# Altium project Flight Controller Base.PrjPcb (part 1 of 2)
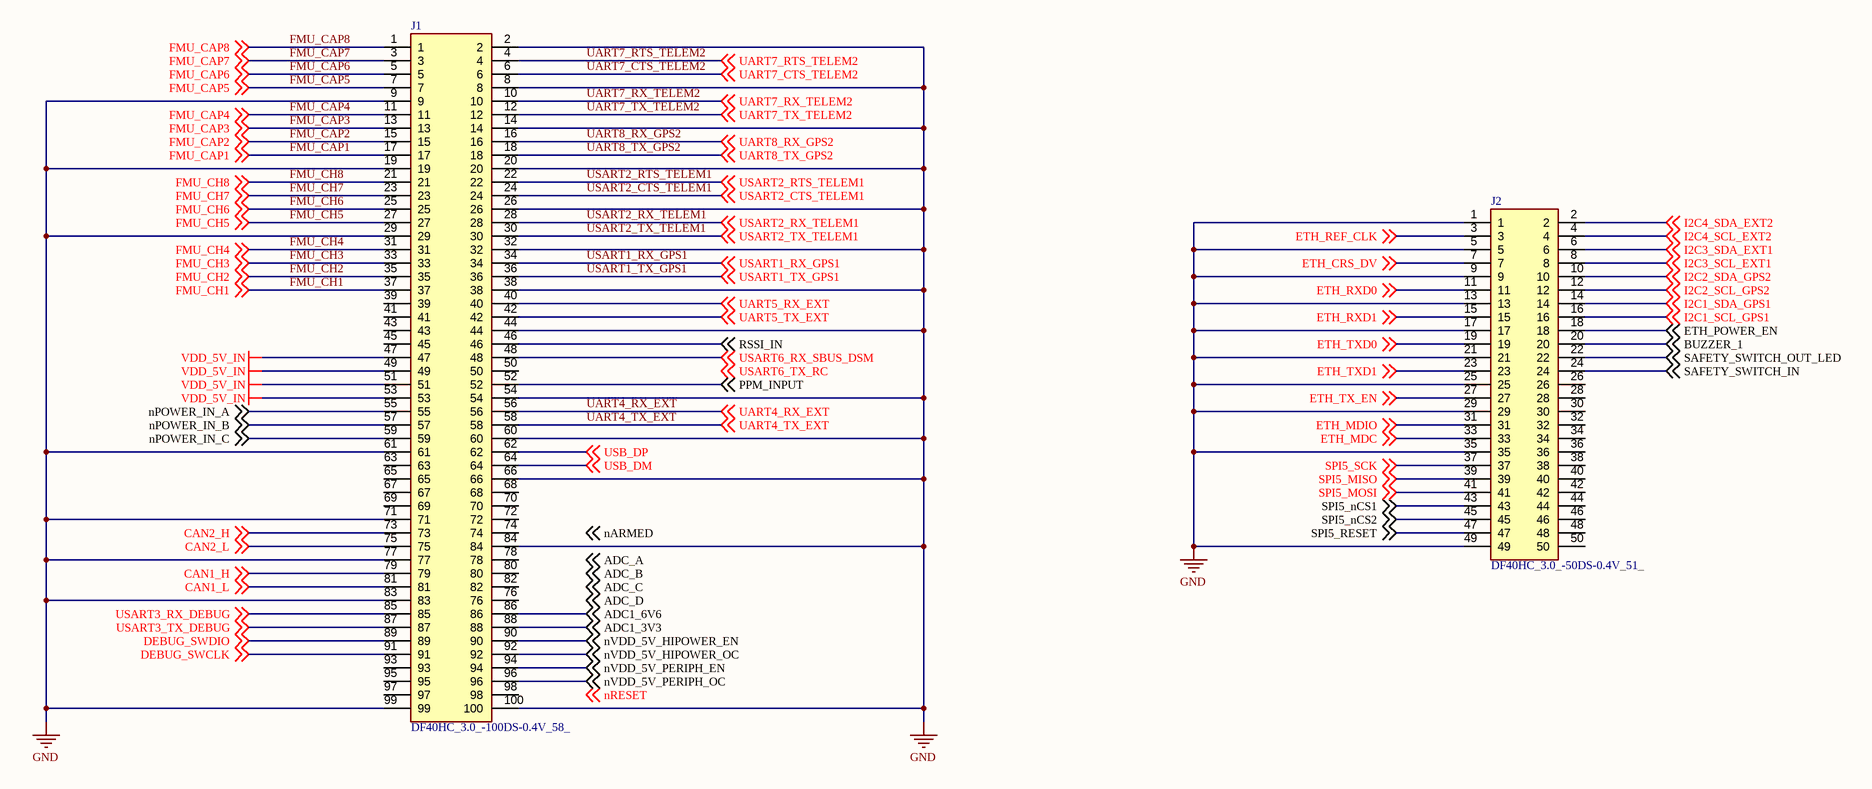
[diagram p0: S1_Connectors.SchDoc]
CAGE_CODE: ?????; CONTRACT_NUMBER: <CONTRACT NO>; DOC_NO_ASSY_DWG: <ASSY DWG NO>; DOC_NO_BOM: <BOM DOC NO>; DOC_NO_FAB_DWG: <FAB DWG NO>; DOC_NO_SCH_DWG: <SCH DWG NO>; PCB_2_DEC_TOL: +/-.01; PCB_3_DEC_TOL: +/-.010; PCB_ANG_TOL: +/-1/2; PCB_ASSEMBLY_NO: <PCB ASSY NO>; PCB_CHECKER: - -----; PCB_CHECKER_APP_DATE: --/--/----; PCB_DESIGNER: - -----; PCB_DESIGNER_APP_DATE: --/--/----; PCB_DWG_NO: <PCB DWG NO>; PCB_ENGINEER: - -----; PCB_ENGINEER_APP_DATE: --/--/----; PCB_PART_NUMBER: <PCB PN>; PCB_REV: A; SCH_REV: A
9 sheets, 243 parts. Net scope: global (net labels, ports and power ports of the same name join across sheets).
Board file: PCB1.PcbDoc
Sheets:
  S1_Connectors.SchDoc
  S2_Power.SchDoc
  S3_PowSwitch.SchDoc
  S4_Pwm_Ports.SchDoc
  S5_Gps_Telem_Ports.SchDoc
  S6_Debug_Safety_Port.SchDoc
  S7_Ethernet.SchDoc
  S6_Can_SPI_Uart_Ports.SchDoc
  S7_CRSF_IBUS_SBUS_DSM_Ports.SchDoc

## Sheet S1_Connectors.SchDoc
size 420 x 297 mm; Title2: hello; Project: myfc_base; ENG_APP_DATE: --/--/--; DSN_APP_DATE: --/--/--; CHK_APP_DATE: --/--/--; SheetNumber: 1; SheetTotal: 8

### Parts
J1  DF40HC_3.0_-100DS-0.4V_58_  [DF40HC30100DS04V58]
J2  DF40HC_3.0_-50DS-0.4V_51_  [DF40HC3050DS04V51]

### Nets
GND: J1.2 J1.8 J1.9 J1.14 J1.19 J1.20 J1.26 J1.29 J1.32 J1.38 J1.44 J1.54 J1.60 J1.61 J1.66 J1.71 J1.77 J1.83 J1.84 J1.99 J1.100 J2.1 J2.5 J2.9 J2.13 J2.17 J2.21 J2.25 J2.29 J2.35 J2.49
VDD_5V_IN: J1.47 J1.49 J1.51 J1.53
ADC1_3V3: J1.88 ; off-sheet ADC1_3V3
ADC1_6V6: J1.86 ; off-sheet ADC1_6V6
BUZZER_1: J2.20 ; off-sheet BUZZER_1
CAN1_H: J1.79 ; off-sheet CAN1_H
CAN1_L: J1.81 ; off-sheet CAN1_L
CAN2_H: J1.73 ; off-sheet CAN2_H
CAN2_L: J1.75 ; off-sheet CAN2_L
DEBUG_SWCLK: J1.91 ; off-sheet DEBUG_SWCLK  [project net SWCLK]
DEBUG_SWDIO: J1.89 ; off-sheet DEBUG_SWDIO  [project net SWDIO]
ETH_CRS_DV: J2.7 ; off-sheet ETH_CRS_DV
ETH_MDC: J2.33 ; off-sheet ETH_MDC
ETH_MDIO: J2.31 ; off-sheet ETH_MDIO
ETH_POWER_EN: J2.18 ; off-sheet ETH_POWER_EN
ETH_REF_CLK: J2.3 ; off-sheet ETH_REF_CLK
ETH_RXD0: J2.11 ; off-sheet ETH_RXD0
ETH_RXD1: J2.15 ; off-sheet ETH_RXD1
ETH_TX_EN: J2.27 ; off-sheet ETH_TX_EN
ETH_TXD0: J2.19 ; off-sheet ETH_TXD0
ETH_TXD1: J2.23 ; off-sheet ETH_TXD1
FMU_CAP1: J1.17 ; off-sheet FMU_CAP1
FMU_CAP2: J1.15 ; off-sheet FMU_CAP2
FMU_CAP3: J1.13 ; off-sheet FMU_CAP3
FMU_CAP4: J1.11 ; off-sheet FMU_CAP4
FMU_CAP5: J1.7 ; off-sheet FMU_CAP5
FMU_CAP6: J1.5 ; off-sheet FMU_CAP6
FMU_CAP7: J1.3 ; off-sheet FMU_CAP7
FMU_CAP8: J1.1 ; off-sheet FMU_CAP8
FMU_CH1: J1.37 ; off-sheet FMU_CH1
FMU_CH2: J1.35 ; off-sheet FMU_CH2
FMU_CH3: J1.33 ; off-sheet FMU_CH3
FMU_CH4: J1.31 ; off-sheet FMU_CH4
FMU_CH5: J1.27 ; off-sheet FMU_CH5
FMU_CH6: J1.25 ; off-sheet FMU_CH6
FMU_CH7: J1.23 ; off-sheet FMU_CH7
FMU_CH8: J1.21 ; off-sheet FMU_CH8
I2C1_SCL_GPS1: J2.16 ; off-sheet I2C1_SCL_GPS1
I2C1_SDA_GPS1: J2.14 ; off-sheet I2C1_SDA_GPS1
I2C2_SCL_GPS2: J2.12 ; off-sheet I2C2_SCL_GPS2
I2C2_SDA_GPS2: J2.10 ; off-sheet I2C2_SDA_GPS2
I2C3_SCL_EXT1: J2.8 ; off-sheet I2C3_SCL_EXT1
I2C3_SDA_EXT1: J2.6 ; off-sheet I2C3_SDA_EXT1
I2C4_SCL_EXT2: J2.4 ; off-sheet I2C4_SCL_EXT2
I2C4_SDA_EXT2: J2.2 ; off-sheet I2C4_SDA_EXT2
nPOWER_IN_A: J1.55 ; off-sheet nPOWER_IN_A
nPOWER_IN_B: J1.57 ; off-sheet nPOWER_IN_B
nPOWER_IN_C: J1.59 ; off-sheet nPOWER_IN_C
nVDD_5V_HIPOWER_EN: J1.90 ; off-sheet nVDD_5V_HIPOWER_EN
nVDD_5V_HIPOWER_OC: J1.92 ; off-sheet nVDD_5V_HIPOWER_OC
nVDD_5V_PERIPH_EN: J1.94 ; off-sheet nVDD_5V_PERIPH_EN
nVDD_5V_PERIPH_OC: J1.96 ; off-sheet nVDD_5V_PERIPH_OC
PPM_INPUT: J1.52 ; off-sheet PPM_INPUT
RSSI_IN: J1.46 ; off-sheet RSSI_IN
SAFETY_SWITCH_IN: J2.24 ; off-sheet SAFETY_SWITCH_IN
SAFETY_SWITCH_OUT_LED: J2.22 ; off-sheet SAFETY_SWITCH_OUT_LED
SPI5_MISO: J2.39 ; off-sheet SPI5_MISO
SPI5_MOSI: J2.41 ; off-sheet SPI5_MOSI
SPI5_nCS1: J2.43 ; off-sheet SPI5_nCS1
SPI5_nCS2: J2.45 ; off-sheet SPI5_nCS2
SPI5_RESET: J2.47 ; off-sheet SPI5_RESET
SPI5_SCK: J2.37 ; off-sheet SPI5_SCK
UART4_RX_EXT: J1.56 ; off-sheet UART4_RX_EXT
UART4_TX_EXT: J1.58 ; off-sheet UART4_TX_EXT
UART5_RX_EXT: J1.40 ; off-sheet UART5_RX_EXT
UART5_TX_EXT: J1.42 ; off-sheet UART5_TX_EXT
UART7_CTS_TELEM2: J1.6 ; off-sheet UART7_CTS_TELEM2
UART7_RTS_TELEM2: J1.4 ; off-sheet UART7_RTS_TELEM2
UART7_RX_TELEM2: J1.10 ; off-sheet UART7_RX_TELEM2
UART7_TX_TELEM2: J1.12 ; off-sheet UART7_TX_TELEM2
UART8_RX_GPS2: J1.16 ; off-sheet UART8_RX_GPS2
UART8_TX_GPS2: J1.18 ; off-sheet UART8_TX_GPS2
USART1_RX_GPS1: J1.34 ; off-sheet USART1_RX_GPS1
USART1_TX_GPS1: J1.36 ; off-sheet USART1_TX_GPS1
USART2_CTS_TELEM1: J1.24 ; off-sheet USART2_CTS_TELEM1
USART2_RTS_TELEM1: J1.22 ; off-sheet USART2_RTS_TELEM1
USART2_RX_TELEM1: J1.28 ; off-sheet USART2_RX_TELEM1
USART2_TX_TELEM1: J1.30 ; off-sheet USART2_TX_TELEM1
USART3_RX_DEBUG: J1.85 ; off-sheet USART3_RX_DEBUG
USART3_TX_DEBUG: J1.87 ; off-sheet USART3_TX_DEBUG
USART6_RX_SBUS_DSM: J1.48 ; off-sheet USART6_RX_SBUS_DSM
USB_DM: J1.64 ; off-sheet USB_DM
USB_DP: J1.62 ; off-sheet USB_DP

Not connected (* = marked no-connect by the designer): J1 39 41 43 45 50 63 65 67 68 69 70 72 74 76 78 80 82 93 95 97 98; J2 26 28 30 32 34 36 38 40 42 44 46 48 50

### Notes on the sheet
- Labels drawn without touching a wire or pin: ADC_A, ADC_B, ADC_C, ADC_D, nARMED, nRESET, USART6_TX_RC
- THIS DOCUMENT AND THE DATA DISCLOSED HEREIN OR
- HEREWITH IS THE PROPERTY OF ALTIUM LIMITED AND MAY
- DWG NO:
- REVISION
- REV:
- DESCRIPTION
- DATE
- APPROVED
- BE FREELY DISTRIBUTED IN WHOLE. NO RIGHTS ARE
- RESERVED OR EXPRESS OR IMPLIED WARANTEE GIVEN.
- ENG:
- APPROVALS
- PROJECT
- DSN:
- CHK:
- REFERENCE DOCUMENTS
- PROJECT REVISION:
- TITLE
- DOCUMENT REVISION:
- DESIGN ITEM:
- BOM:
- FAB DWG:
- PCB DWG:
- ASSY DWG:
- SCALE:
- A3
- SIZE
- CAGE CODE
- FILE NAME
- DWG NO.
- SHEET
- OF
- REV

### Library data of the parts
J1 = CMP-002-00075-1: Hirose DF40 Series 0.4mm Pitch 100 Way 2 Row Straight PCB Socket, Surface Mount, Solder Termination; Manufacturer_Part_Number: DF40HC(3.0)-100DS-0.4V(58); Geometry.Height: 3.05mm; Datasheet Link: https://www.hirose.com/product/document?clcode=CL0684-4003-3-51&productname=DF40C-60DP-0.4V(51)&series=DF40&documenttype=Catalog&lang=en&documentid=D31649_en; Mouser Price/Stock: *; Source: DF40HC_3.0_-100DS-0.4V_58_.SchLib; Mouser Part Number: *; Design Item ID: DF40HC_3.0_-100DS-0.4V_58_; Manufacturer_Name: Hirose
J2 = CMP-002-00077-1: Board to Board & Mezzanine Connectors 50P RECPT 3.0 STK HT W/O METAL FITTING; Manufacturer_Name: Hirose; Manufacturer_Part_Number: DF40HC(3.0)-50DS-0.4V(51); Geometry.Height: 3.05mm; Design Item ID: DF40HC_3.0_-50DS-0.4V_51_; Datasheet Link: https://www.arrow.com/en/products/df40hc-3.0-50ds-0.4v-51/hirose-electric?region=nac; Mouser Part Number: 798-DF40HC3050DS04V; Mouser Price/Stock: https://www.mouser.co.uk/ProductDetail/Hirose-Connector/DF40HC3.0-50DS-0.4V51?qs=3aug5cyrIbckh%2FQLfpkocw%3D%3D; Source: DF40HC_3.0_-50DS-0.4V_51_.SchLib

## Sheet S2_Power.SchDoc
size 420 x 297 mm; SheetNumber: 2; SheetTotal: 7
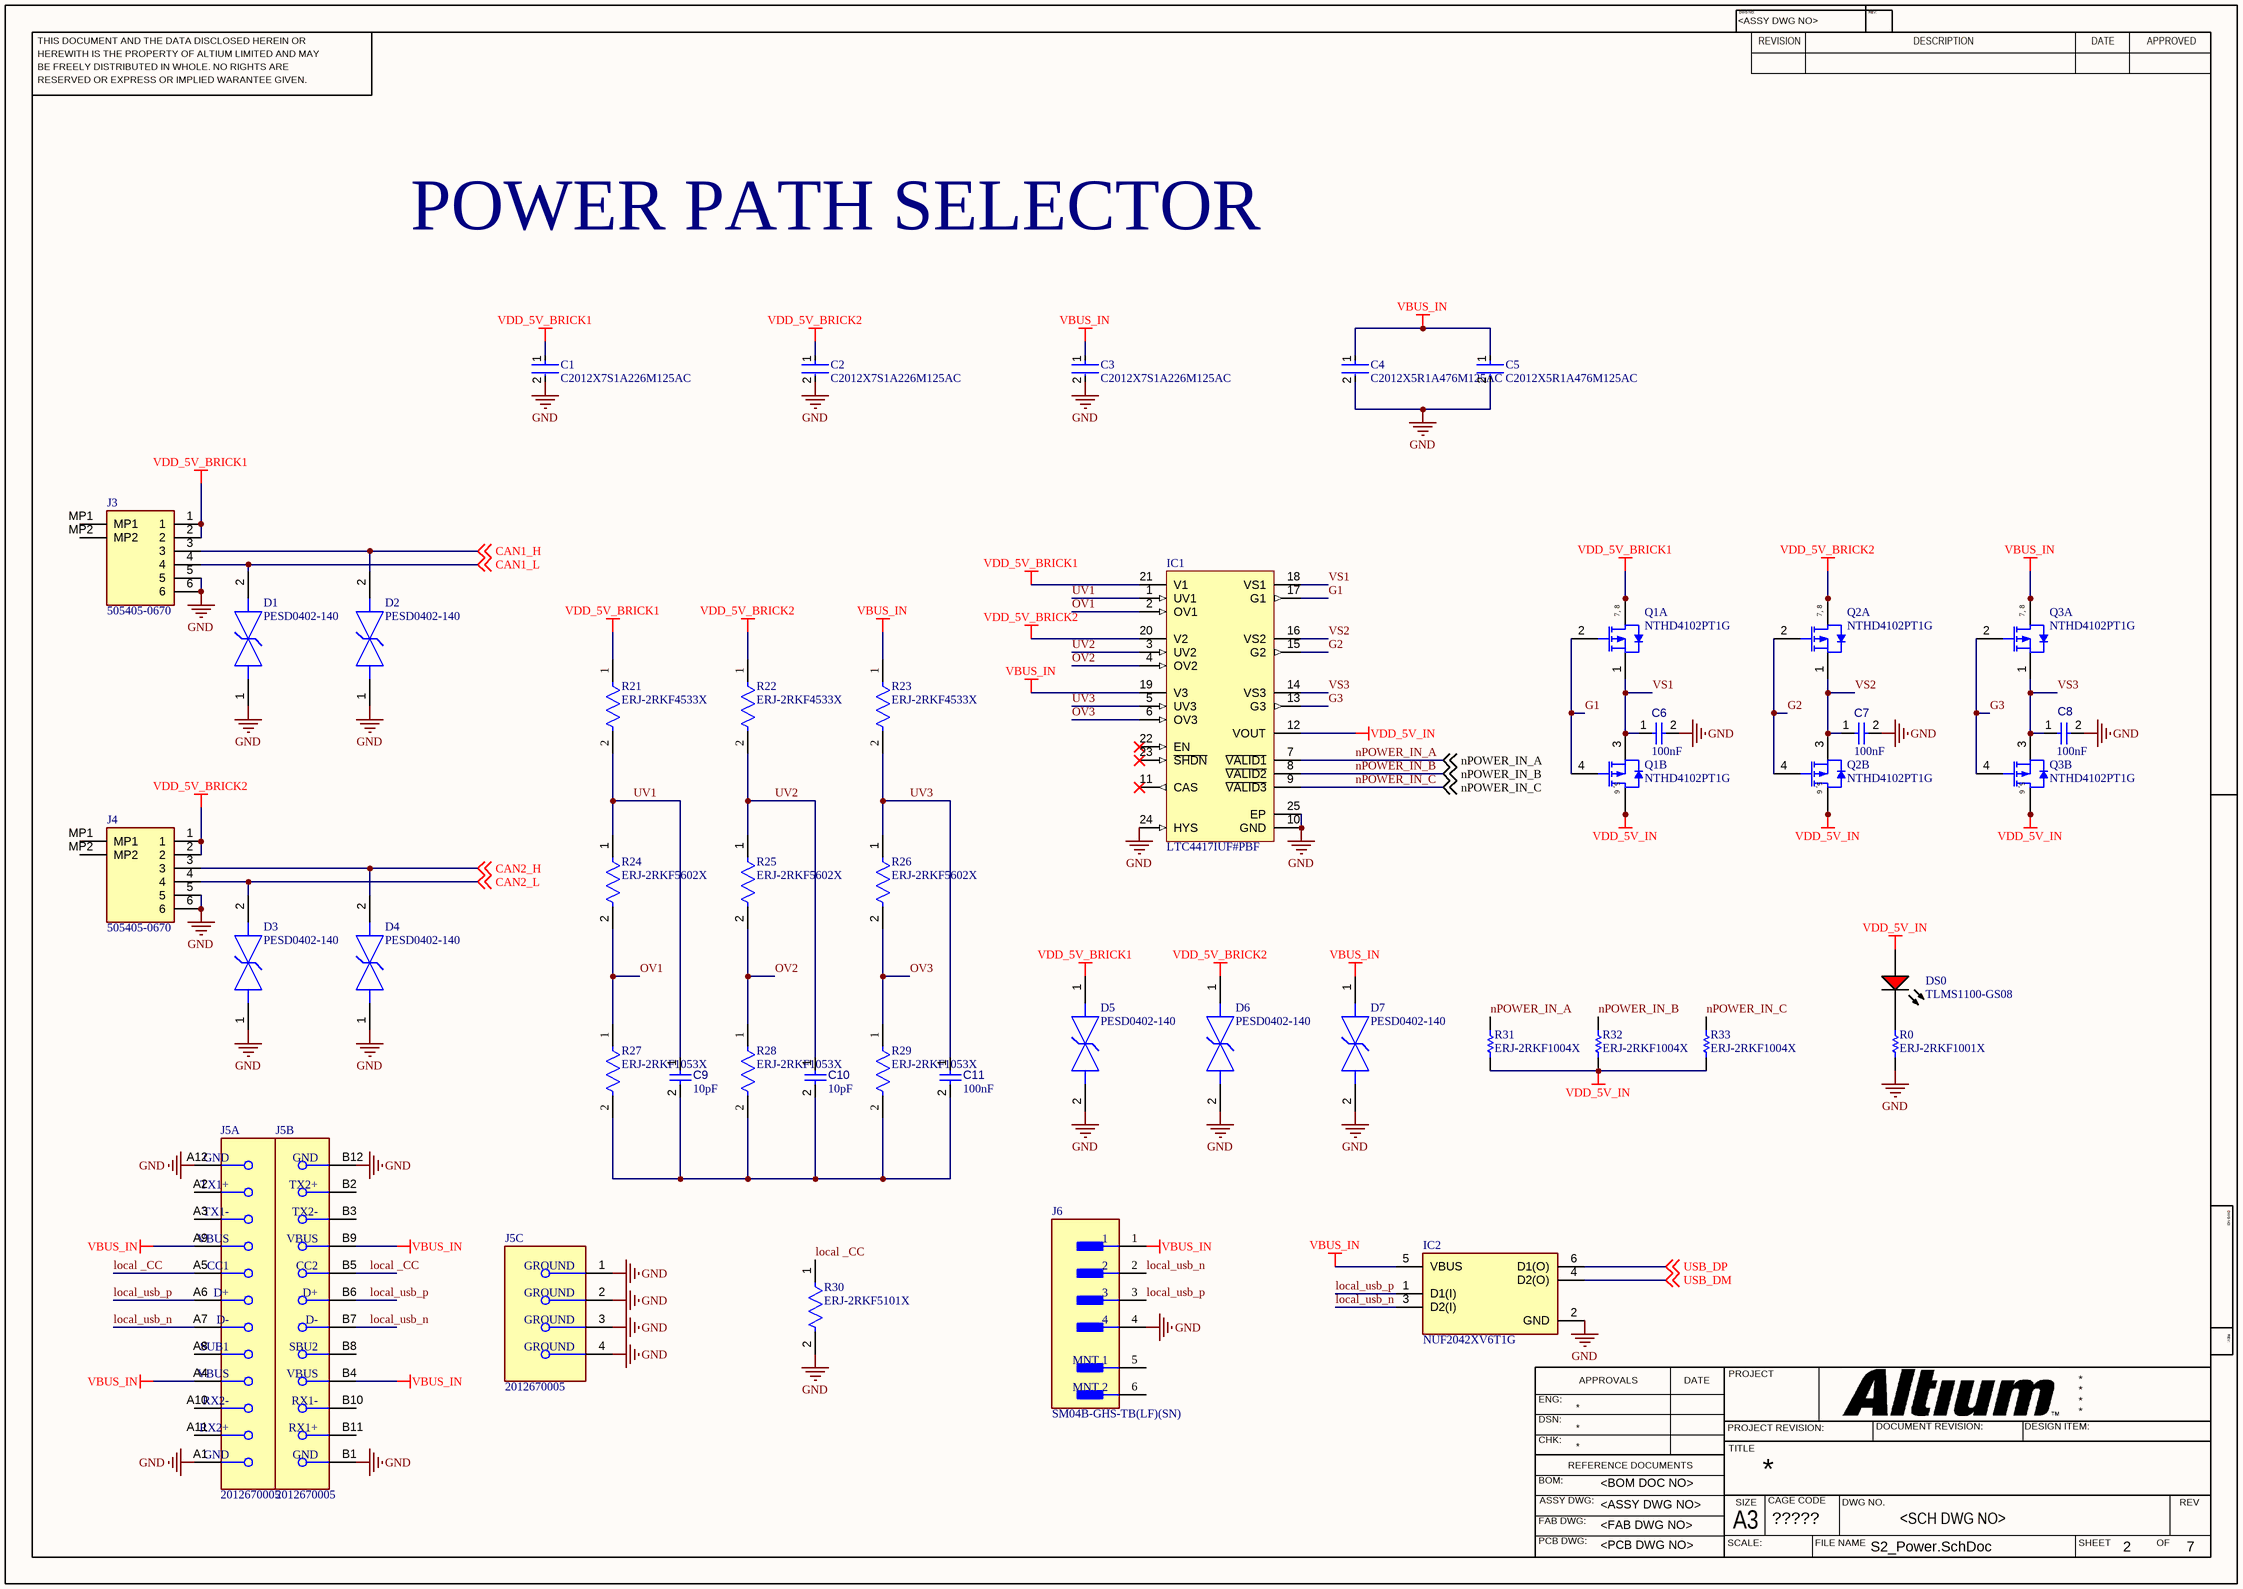
[diagram p1: S2_Power.SchDoc]

### Parts
C1  C2012X7S1A226M125AC  [FP-C2012-125-0_2-IPC_B]
C2  C2012X7S1A226M125AC  [FP-C2012-125-0_2-IPC_B]
C3  C2012X7S1A226M125AC  [FP-C2012-125-0_2-IPC_B]
C4  C2012X5R1A476M125AC  [FP-C2012-125-0_2-IPC_B]
C5  C2012X5R1A476M125AC  [FP-C2012-125-0_2-IPC_B]
C6  value 100nF  [CAPC0402(1005)60_L]  (hidden comment: Capacitor 100nF +/-20% 25V 0402)
C7  value 100nF  [CAPC0402(1005)60_L]  (hidden comment: Capacitor 100nF +/-20% 25V 0402)
C8  value 100nF  [CAPC0402(1005)60_L]  (hidden comment: Capacitor 100nF +/-20% 25V 0402)
C9  value 10pF  [CAPC1608X87X35NL15T15]  (hidden comment: Capacitor 10 pF +/- 0.25 pF 50 V 0603)
C10  value 10pF  [CAPC1608X87X35NL15T15]  (hidden comment: Capacitor 10 pF +/- 0.25 pF 50 V 0603)
C11  value 100nF  [CAPC0402(1005)60_L]  (hidden comment: Capacitor 100nF +/-20% 25V 0402)
D1  PESD0402-140  [FP-PESD0402-MFG]
D2  PESD0402-140  [FP-PESD0402-MFG]
D3  PESD0402-140  [FP-PESD0402-MFG]
D4  PESD0402-140  [FP-PESD0402-MFG]
D5  PESD0402-140  [FP-PESD0402-MFG]
D6  PESD0402-140  [FP-PESD0402-MFG]
D7  PESD0402-140  [FP-PESD0402-MFG]
DS0  TLMS1100-GS08  [VISH-TLMX1100_V]
IC1  LTC4417IUF#PBF  [LT-UF-24_N]
IC2  NUF2042XV6T1G  [FP-463A-MFG]
J3  505405-0670  [5054050670]
J4  505405-0670  [5054050670]
J5  2012670005  [FP-2012670005-MFG]  (parts A,B,C of 3)
J6  SM04B-GHS-TB(LF)(SN)  [FP-SM04B-GHS-TB_LF_SN-MFG]
Q1  NTHD4102PT1G  [ONSC-CHIPFET-8-1206A-03_S2_V]  (parts A,B of 2)
Q2  NTHD4102PT1G  [ONSC-CHIPFET-8-1206A-03_S2_V]  (parts A,B of 2)
Q3  NTHD4102PT1G  [ONSC-CHIPFET-8-1206A-03_S2_V]  (parts A,B of 2)
R0  ERJ-2RKF1001X  [RESC1005X40X25NL05T05]
R21  ERJ-2RKF4533X  [FP-ERJ2RK-MFG]
R22  ERJ-2RKF4533X  [FP-ERJ2RK-MFG]
R23  ERJ-2RKF4533X  [FP-ERJ2RK-MFG]
R24  ERJ-2RKF5602X  [FP-ERJ2R-IPC_A]
R25  ERJ-2RKF5602X  [FP-ERJ2R-IPC_A]
R26  ERJ-2RKF5602X  [FP-ERJ2R-IPC_A]
R27  ERJ-2RKF1053X  [FP-ERJ2RK-MFG]
R28  ERJ-2RKF1053X  [FP-ERJ2RK-MFG]
R29  ERJ-2RKF1053X  [FP-ERJ2RK-MFG]
R30  ERJ-2RKF5101X  [FP-ERJ2RK-IPC_A]
R31  ERJ-2RKF1004X  [RESC1005X40X25LL05T05]
R32  ERJ-2RKF1004X  [RESC1005X40X25LL05T05]
R33  ERJ-2RKF1004X  [RESC1005X40X25LL05T05]

### Nets
GND: C1.2 C2.2 C3.2 C4.2 C5.2 C6.2 C7.2 C8.2 D1.1 D2.1 D3.1 D4.1 D5.2 D6.2 D7.2 IC1.10(GND) IC1.24(HYS) IC1.25(EP) IC2.2(GND) J3.5 J3.6 J4.5 J4.6 J5.1(GROUND) J5.2(GROUND) J5.3(GROUND) J5.4(GROUND) J5.A1(GND) J5.A12(GND) J5.B1(GND) J5.B12(GND) J6.4 R0.1 R30.2
VBUS_IN: C3.1 C4.1 C5.1 D7.1 IC1.19(V3) IC2.5(VBUS) J5.A4(VBUS) J5.A9(VBUS) J5.B4(VBUS) J5.B9(VBUS) J6.1 Q3.7(D1) Q3.8(D1) R23.1
VDD_5V_BRICK1: C1.1 D5.1 IC1.21(V1) J3.1 J3.2 Q1.7(D1) Q1.8(D1) R21.1
VDD_5V_BRICK2: C2.1 D6.1 IC1.20(V2) J4.1 J4.2 Q2.7(D1) Q2.8(D1) R22.1
VDD_5V_IN: DS0.1(A) IC1.12(VOUT) Q1.5(D2) Q1.6(D2) Q2.5(D2) Q2.6(D2) Q3.5(D2) Q3.6(D2) R31.1 R32.1 R33.1
CAN1_H: D2.2 J3.3 ; off-sheet CAN1_H
CAN1_L: D1.2 J3.4 ; off-sheet CAN1_L
CAN2_H: D4.2 J4.3 ; off-sheet CAN2_H
CAN2_L: D3.2 J4.4 ; off-sheet CAN2_L
G1: IC1.17(G1) Q1.2(G1) Q1.4(G2)
G2: IC1.15(G2) Q2.2(G1) Q2.4(G2)
G3: IC1.13(G3) Q3.2(G1) Q3.4(G2)
local _CC: J5.A5(CC1) J5.B5(CC2) R30.1
local_usb_n: IC2.3(D2(I)) J5.A7(D-) J5.B7(D-) J6.2
local_usb_p: IC2.1(D1(I)) J5.A6(D+) J5.B6(D+) J6.3
nPOWER_IN_A: IC1.7(~{VALID1}) R31.2 ; off-sheet nPOWER_IN_A
nPOWER_IN_B: IC1.8(~{VALID2}) R32.2 ; off-sheet nPOWER_IN_B
nPOWER_IN_C: IC1.9(~{VALID3}) R33.2 ; off-sheet nPOWER_IN_C
OV1: IC1.2(OV1) R24.2 R27.1
OV2: IC1.4(OV2) R25.2 R28.1
OV3: IC1.6(OV3) R26.2 R29.1
USB_DM: IC2.4(D2(O)) ; off-sheet USB_DM
USB_DP: IC2.6(D1(O)) ; off-sheet USB_DP
UV1: C9.1 IC1.1(UV1) R21.2 R24.1
UV2: C10.1 IC1.3(UV2) R22.2 R25.1
UV3: C11.1 IC1.5(UV3) R23.2 R26.1
VS1: C6.1 IC1.18(VS1) Q1.1(S1) Q1.3(S2)
VS2: C7.1 IC1.16(VS2) Q2.1(S1) Q2.3(S2)
VS3: C8.1 IC1.14(VS3) Q3.1(S1) Q3.3(S2)
NetC9_2: C9.2 C10.2 C11.2 R27.2 R28.2 R29.2
NetDS0_2: DS0.2(K) R0.2

Not connected (* = marked no-connect by the designer): IC1 11(CAS)* 22(EN)* 23(~{SHDN})*; J3 MP1 MP2; J4 MP1 MP2; J5 A2(TX1+) A3(TX1-) A8(SUB1) A10(RX2-) A11(RX2+) B2(TX2+) B3(TX2-) B8(SBU2) B10(RX1-) B11(RX1+); J6 5(MNT_1) 6(MNT_2)

### Notes on the sheet
- POWER PATH SELECTOR
- THIS DOCUMENT AND THE DATA DISCLOSED HEREIN OR
- HEREWITH IS THE PROPERTY OF ALTIUM LIMITED AND MAY
- DWG NO:
- REVISION
- REV:
- DESCRIPTION
- DATE
- APPROVED
- BE FREELY DISTRIBUTED IN WHOLE. NO RIGHTS ARE
- RESERVED OR EXPRESS OR IMPLIED WARANTEE GIVEN.
- ENG:
- APPROVALS
- PROJECT
- DSN:
- CHK:
- REFERENCE DOCUMENTS
- PROJECT REVISION:
- TITLE
- DOCUMENT REVISION:
- DESIGN ITEM:
- BOM:
- FAB DWG:
- PCB DWG:
- ASSY DWG:
- SCALE:
- A3
- SIZE
- CAGE CODE
- FILE NAME
- DWG NO.
- SHEET
- OF
- REV

### Library data of the parts
C1-C3 = CMP-08246-005250-1: Multilayer Ceramic Capacitors 22μF ±20% 10V X7S SMD 0805; Capacitance: 22uF; Height: 1.25mm; Case Code (Metric): 2012; Mount: Surface Mount; RoHS Compliant: Yes; Dielectric Material: Ceramic; Package Quantity: 2000; Tolerance: 20%; Min Operating Temperature: -55°C; REACH SVHC: No SVHC; Weight: 0.000194oz; Voltage Rating: 10V; Thickness: 0.057inch; Series: C; Termination: SMD/SMT; Length: 0.079inch; Max Operating Temperature: 125°C; Width: 1.25mm; Packaging: Tape and Reel; Dielectric: X7S; Case Code (Imperial): 0805; Voltage Rating (DC): 10V; Lead Free: Lead Free; Case/Package: 0805
C4 C5 = CMP-2000-05451-2: Multilayer Ceramic Capacitors 47μF ±20% 10V X5R SMD 0805; Capacitance: 47uF; RoHS Compliant: Yes; Dielectric: X5R; Case Code (Imperial): 0805; Min Operating Temperature: -55°C; Length: 2mm; Voltage Rating: 10V; Lead Free: Lead Free; Weight: 0.000194oz; Resistor Type: Ceramic; Dielectric Material: Ceramic; Max Operating Temperature: 85°C; Height: 1.25mm; Width: 0.049inch; Depth: 1.25mm; Termination: SMD/SMT; Case/Package: 0805; Voltage Rating (DC): 10V; Voltage: 10V; Thickness: 0.057inch; Tolerance: 20%; REACH SVHC: No SVHC; Package Quantity: 1; Series: C; Case Code (Metric): 2012; Mount: Surface Mount; Packaging: Tape and Reel
C6-C8 C11 = CMP-001-00065-4: Chip Capacitor, 100nF +/-20%, 25V, 0402, Thickness 0.6 mm; Tolerance: 10%; Max Operating Temperature: 85°C; Min Operating Temperature: -55°C; Pins: 2; Voltage Rating: 25V; Mounting Technology: SMT; Case/Package: 0402
C9 C10 = CMP-001-00012-6: Chip Capacitor, 10 pF, +/- 0.25 pF, 50 V, 0603 (1608 Metric); Tolerance: 0.25%; Capacitor Type: Ceramic; Voltage Rating: 50V; Max Operating Temperature: 125°C; RoHS Compliant: True; Mounting Technology: SM; Pins: 2; Case/Package: 0603; Min Operating Temperature: -55°C
D1-D7 = CMP-08607-000011-1: TVS DIODE 14V 40V 0402; Manufacturer: Littelfuse Inc.; Automotive Grade: Grade 1; Capacitance: 0.25pF; Value: 0.25pF; Direction: Bidirectional; Number Of Channels: 1; Temperature Range Low: -55°C; Lead Free: Yes; Temperature: -55°C to +125°C; Digikey Description: TVS DIODE 14V 40V 0402; Automotive: Yes; Device Class L2: TVS Diodes; Reverse Standoff Voltage: 14V; Device Class L1: Circuit Protection; Ipc Land Pattern Name: DIOC10050X33; Manufacturer Part Number: PESD0402-140; Breakdown Voltage: 14V; Height: 0.43mm; Clamping Voltage: 40V; RoHS: TRUE; Temperature Range High: +125°C; Device Class L3: unset; Octopart: https://octopart.com/pesd0402-140-littelfuse-74215061; Package: PESD0402; ComponentLink2URL: https://www.littelfuse.com/~/media/electronics/datasheets/polymer_esd_suppressors/littelfuse_polymer_esd_suppressor_pesd_catalog_datasheet.pdf.pdf; Category: Diode; ComponentLink2Description: Datasheet
DS0 = CMP-1666-00027-1: LED, RED, 2.1 V, -40 to 100 degC, 2-Pin SMD (0603), RoHS, Tape and Reel; Type (Capacitors): C0G; Resistance: 100000000000 Ohm; Capacitance: 12 pF; Voltage Rating: 50 V; Tolerance: 5%; Min Operating Temperature: -55degC; REACH SVHC: No SVHC; ComponentLink2Description: Datasheet; ComponentLink1URL: http://www.vishay.com/; Width: 0.8 mm; Package Quantity: 4000; PackageReference: TLMX1100; ComponentLink2URL: http://www.vishay.com/docs/83173/tlmb1100.pdf; Case/Package: 0603; Case Code (Metric): 1608; Packaging: Tape and Reel; Pins: 2; ComponentLink1Description: Manufacturer URL; Max Operating Temperature: 125degC; Height: 0.8 mm; Length: 1.6 mm; Mount: Surface Mount; PackageDescription: 2-Pin Surface Mount Device, Body 1.6 x 0.8 mm; DatasheetVersion: Rev. 2.7, 03/2016; Case Code (Imperial): 0603; Voltage Rating (DC): 50 V; RoHSCompliant: True; Radiation Hardening: No
IC1 = CMP-0479-00652-1: Prioritized PowerPath Controller, 2.5 to 36 V Vin, 24-pin QFN (UF-24), -40 to 85 degC, Pb-Free; Manufacturer: Linear Technology; Ideal Diode: Triple, External, P-Channel; ComponentLink3URL: http://cds.linear.com/docs/en/packaging/%28UF24%29%20QFN%2005-08-1697%20Rev%20B.pdf; ComponentLink3Description: Package Specification; PartNumber: LTC4417IUF#PBF; PackageVersion: Rev. B, 02/2012; ComponentLink2URL: http://cds.linear.com/docs/en/datasheet/4417f.pdf; PackageReference: UF24; ComponentLink1Description: Manufacturer URL; ComponentLink2Description: Datasheet; PackageDescription: 24-Pin Plastic QFN, Body 4 x 4 mm, Pitch 0.5 mm; ComponentLink1URL: http://www.linear.com/; Code_JEDEC: MO-220; RoHS: TRUE; Mounting Technology: Surface Mount
IC2 = CMP-1066-00027-2: FILTER RC(PI) 22 OHM/42PF SMD; Max DC Current: 100nA; Max Breakdown Voltage: 8V; Direction: Bidirectional; Capacitance: 42pF; Number of Channels: 3; DC Resistance (DCR): 26.4R; ESD Protection: Yes; Length: 0.063inch; Package Quantity: 4000; Case/Package: SOT-563-6; Termination: Gull Wing; Radiation Hardening: No; Lead Free: Lead Free; Halogen Free: Halogen Free; Width: 0.047inch; Min Operating Temperature: -55°C; Packaging: Tape and Reel; Height: 0.024inch; Number of Pins: 6; Max Operating Temperature: 125°C; Contact Plating: Tin; Number of Lines: 3; Depth: 1.7mm
J3 J4 = CMP-002-00078-1: Headers & Wire Housings 1.5 CLIKMate REC WB 6CKT VRT SR GLD PLTG; Manufacturer_Name: Molex; Geometry.Height: 6.35mm; Datasheet Link: https://componentsearchengine.com/Datasheets/1/505405-0670.pdf; Manufacturer_Part_Number: 505405-0670; Mouser Price/Stock: https://www.mouser.co.uk/ProductDetail/Molex/505405-0670?qs=eKig3M7YXu%252B%252BB9S4VwyG6w%3D%3D; Source: 505405-0670.SchLib; Design Item ID: 505405-0670; Mouser Part Number: 538-505405-0670
J5 = CMP-04767-000003-1: CONN RCP USB3.1 TYPEC 24P SMD RA; Manufacturer: Molex; Is Female: yes; Conn Orientation: Right Angle; Shielding: true; Number Of Contacts: 24; Pitch: 0.5mm; Current Rating: 0.25/1.25/5A; Voltage Rating: 30V; Temperature: -40°C to +105°C; ComponentLink2Description: Datasheet; Octopart: https://octopart.com/201267-0005-molex-77836528; Height: 3.86mm; Contact Material: Gold,Nickel; ComponentLink2URL: https://www.molex.com/webdocs/datasheets/pdf/en-us/2012670005_IO_CONNECTORS.pdf; Footprint Url: https://www.molex.com/pdm_docs/sd/2012670005_sd.pdf; Digikey Description: CONN RCP USB3.1 TYPEC 24P SMD RA; Temperature Range High: +105°C; Automotive: No; RoHS: TRUE; Manufacturer Part Number: 2012670005; Device Class L3: unset; Device Class L2: USB Connectors; Category: Conn; Lead Free: Yes; Usb Standard: USB 3.1; Device Class L1: Connectors; Temperature Range Low: -40°C; Package: 2012670005
J6 = CMP-17439-000411-1: CONN HEADER SMD R/A 4POS 1.25MM; Voltage Rating: 50V; Number of Contacts: 4; Current Rating: 1A; Termination: Solder; Mount: Surface Mount; REACH SVHC: No SVHC; Packaging: Cut Tape; Contact Material: Bronze; Series: GH; Orientation: Right Angle; Lead Free: Lead Free; Housing Material: Nylon; Contact Plating: Tin; Housing Color: Natural; Number of Rows: 1; Pitch: 1.25mm; Number of Positions: 4
Q1-Q3 = CMP-1058-00037-1: Power MOSFET, -20 V, -4.1 A, Dual P-Channel, 8-Pin CHIPFET, Pb-Free, Tape and Reel; Manufacturer: On Semiconductor; ID Max (A): 4.1; VGS(th) Max (V): 1.5; Coss Typ (pF): 100; V(BR)DSS Min (V): 20; Ciss Typ (pF): 750; Crss Typ (pF): 45; Qrr Typ (nC): 10; Channel Polarity: P Channel; VGS Max (V): 8; PackageVersion: Rev. E, 10/2004; Mounting Technology: Surface Mount; ComponentLink2URL: http://www.onsemi.com/pub_link/Collateral/NTHD4102P-D.PDF; DatasheetVersion: Rev. 6; ComponentLink1URL: http://www.onsemi.com/; Packing: Tape and Reel; ComponentLink2Description: Datasheet; PackageReference: CHIPFET-8-1206A-03_S2; PackageDescription: 8-Pin ChipFET, Body 3.025 x 1.625 mm, Pitch 0.635 mm; RoHS: Pb-Free; ComponentLink1Description: Manufacturer URL; ComponentLink3Description: Package Specification; Package Type: ChipFET-8; Configuration: Dual; PartNumber: NTHD4102PT1G; ComponentLink3URL: http://www.onsemi.com/pub_link/Collateral/NTHC5513-D.PDF
R0 = CMP-1011-00510-4: Chip Resistor, 1 KOhm, +/- 1%, 100 mW, -55 to 155 degC, 0402 (1005 Metric), RoHS, Tape and Reel; Manufacturer: Basic Passives; Voltage Rating: 50 V; Case\/Package: 0402; Resistance: 1 KOhm; Power Rating: 100 mW; PartNumber: ERJ-2RKF1001X; DatasheetVersion: 04/2015; Radiation Hardening: No; Pins: 2; Height: 0.35 mm; RoHSCompliant: true; Case Code (Imperial): 0402; ComponentLink2Description: Datasheet; ComponentLink1Description: Manufacturer URL; PackageReference: 0402; Mount: Surface Mount; Package Quantity: 10000; Tolerance: 1%; ComponentLink1URL: http://www.panasonic.com/; PackageDescription: 2-Pin Surface Mount Device, Body 1 x 0.5 mm; Mounting Technology: Surface Mount; Case Code (Metric): 1005; ComponentLink2URL: http://industrial.panasonic.com/cdbs/www-data/pdf/RDA0000/AOA0000C86.pdf; REACH SVHC: Yes; Packaging: Tape and Reel; Max Operating Temperature: 155 degC; Min Operating Temperature: -55 degC; Width: 0.5 mm; Length: 1 mm
R21-R23 = CMP-2002-00948-2: NexarPartId: 55421189; Power Rating: 100mW; Resistance: 453kΩ; Temperature Coefficient: 100ppm/°C; Tolerance: 1%; Voltage Rating (DC): 50V; Case Code (Metric): 1005; RoHS: Compliant; Length: 1mm; Case Code (Imperial): 0402; Depth: 500µm; Lead Free: Lead Free; Mount: Surface Mount; Termination: SMD/SMT; Schedule B: 8533210045, 8533210045; Max Operating Temperature: 155°C; Max Power Dissipation: 100mW; Width: 508µm; Case/Package: 0402; Military Standard: Not; Number of Terminations: 2; Contact Plating: Tin; Lifecycle Status: Production; Composition: Thick Film; Min Operating Temperature: -55°C; Height: 350µm; Packaging: Cut Tape; Voltage Rating: 50V; REACH SVHC: Yes
R24-R26 = CMP-2002-01161-3: RES SMD 56K OHM 1% 1/10W 0402; Voltage Rating: 50V; Temperature Coefficient: 100ppm/°C; Power Rating: 100mW; Resistance: 56kR; Case Code (Metric): 1005; Contact Plating: Tin; Series: ERJ; Tolerance: 1%; Min Operating Temperature: -55°C; Resistor Type: Thick Film; Construction: Rectangular; Lead Free: Lead Free; Max Operating Temperature: 155°C; Packaging: Tape and Reel; Length: 1mm; Height: 0.35mm; Voltage Rating (DC): 50V; Number of Terminations: 2; Package Quantity: 10000; Case Code (Imperial): 0402; Depth: 0.5mm; Features: Automotive AEC-Q200; Reach SVHC Compliant: Yes; Radiation Hardening: No; Max Power Dissipation: 100mW; Case/Package: 0402; Technology: THICK FILM; Width: 0.5mm; Resistance Tolerance: 1%; Mount: Surface Mount; Termination: SMD/SMT; Ratings: AEC-Q200; RoHS Compliant: Yes; Number of Pins: 2; Military Standard: Not
R27-R29 = CMP-1011-00738-3: NexarPartId: 55389234; Voltage Rating (DC): 50V; Resistance: 105kΩ; Max Power Dissipation: 100mW; Tolerance: 1%; Temperature Coefficient: 100ppm/°C; Height: 406.4µm; Case Code (Metric): 1005; Schedule B: 8533210045, 8533210045; Radiation Hardening: No; Case Code (Imperial): 0402; Length: 1mm; Lifecycle Status: Production; Width: 500µm; Contact Plating: Tin; Military Standard: Not; Composition: Thick Film; REACH SVHC: No SVHC; Lead Free: Lead Free; Case/Package: 0402; Min Operating Temperature: -55°C; Features: Automotive AEC-Q200; Max Operating Temperature: 155°C; Packaging: Cut Tape; Voltage Rating: 50V; RoHS: Compliant; Power Rating: 100mW; Depth: 500µm; Termination: SMD/SMT; Number of Terminations: 2; Mount: Surface Mount
R30 = CMP-2002-01158-2: RES SMD 5.1K OHM 1% 1/10W 0402; Voltage Rating: 50V; Temperature Coefficient: 100ppm/°C; Resistance: 5.1kR; Power Rating: 100mW; Min Operating Temperature: -55°C; Technology: THICK FILM; Military Standard: Not; Depth: 0.5mm; Contact Plating: Tin; Tolerance: 1%; Construction: Rectangular; Length: 1mm; Case/Package: 0402; Lead Free: Lead Free; RoHS Compliant: Yes; Termination: SMD/SMT; Height: 0.35mm; Max Operating Temperature: 155°C; Case Code (Imperial): 0402; Number of Terminations: 2; Packaging: Tape and Reel; Case Code (Metric): 1005; Width: 0.5mm; Max Power Dissipation: 100mW; Package Quantity: 10000; Resistance Tolerance: 1%; REACH SVHC: No SVHC; Mount: Surface Mount; Series: ERJ; Voltage Rating (DC): 50V; Weight: 2.8E-05oz; Resistor Type: Thick Film
R31-R33 = CMP-2002-00609-3: Chip Resistor, 1 MOhm, +/- 1%, 100 mW, -55 to 155 degC, 0402 (1005 Metric), RoHS, Tape and Reel; Manufacturer: Basic Passives; Voltage Rating: 50 V; Case\/Package: 0402; Resistance: 1 MOhm; Power Rating: 100 mW; Pins: 2; Max Operating Temperature: 155 degC; ComponentLink2URL: http://industrial.panasonic.com/cdbs/www-data/pdf/RDA0000/AOA0000C86.pdf; Weight: 2.8E-05oz; ComponentLink1URL: http://www.panasonic.com/; Radiation Hardening: No; Height: 0.35 mm; Case Code (Imperial): 0402; ComponentLink2Description: Datasheet; Mount: Surface Mount; ComponentLink1Description: Manufacturer URL; REACH SVHC: Yes; PartNumber: ERJ-2RKF1004X; Length: 1 mm; Min Operating Temperature: -55 degC; Width: 0.5 mm; Package Quantity: 10000; Tolerance: 1%; PackageDescription: 2-Pin Surface Mount Device, Body 1 x 0.5 mm; RoHSCompliant: true; DatasheetVersion: 04/2015; PackageReference: 0402; Mounting Technology: Surface Mount; Case Code (Metric): 1005; Packaging: Tape and Reel

## Sheet S3_PowSwitch.SchDoc
size 420 x 297 mm; SheetNumber: 3; SheetTotal: 7
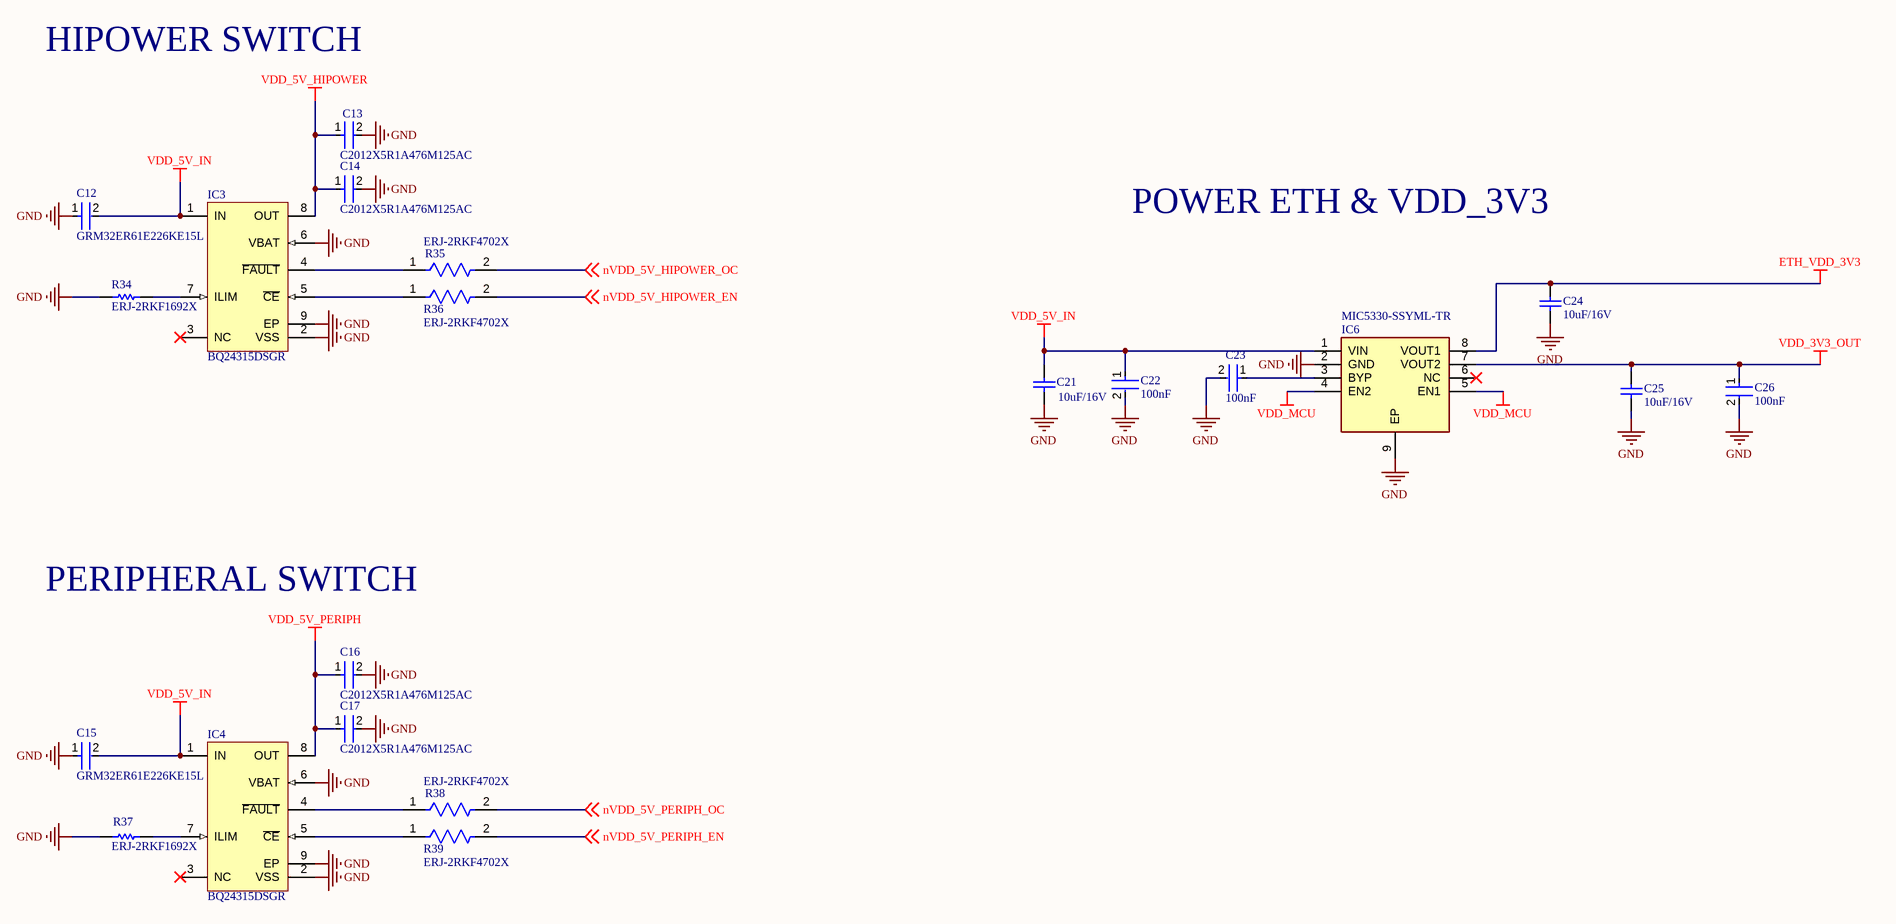
[diagram p2: S3_PowSwitch.SchDoc]

### Parts
C12  GRM32ER61E226KE15L  [FP-GRM32-MFG]
C13  C2012X5R1A476M125AC  [FP-C2012-125-0_2-IPC_B]
C14  C2012X5R1A476M125AC  [FP-C2012-125-0_2-IPC_B]
C15  GRM32ER61E226KE15L  [FP-GRM32-MFG]
C16  C2012X5R1A476M125AC  [FP-C2012-125-0_2-IPC_B]
C17  C2012X5R1A476M125AC  [FP-C2012-125-0_2-IPC_B]
C21  10uF/16V  [CAPC1210(3225)210_L]
C22  100nF  [FP-CC0402-MFG]
C23  100nF  [FP-CC0402-MFG]
C24  10uF/16V  [CAPC1210(3225)210_L]
C25  10uF/16V  [CAPC1210(3225)210_L]
C26  100nF  [FP-CC0402-MFG]
IC3  BQ24315DSGR  [DSG0008A_V]
IC4  BQ24315DSGR  [DSG0008A_V]
IC6  MIC5330-SSYML-TR  [SON50P200X200X95-9N-D]
R34  ERJ-2RKF1692X  [RESC1005X40X25ML05T05]
R35  ERJ-2RKF4702X  [FP-ERJ2RK-IPC_B]
R36  ERJ-2RKF4702X  [FP-ERJ2RK-IPC_B]
R37  ERJ-2RKF1692X  [RESC1005X40X25ML05T05]
R38  ERJ-2RKF4702X  [FP-ERJ2RK-IPC_B]
R39  ERJ-2RKF4702X  [FP-ERJ2RK-IPC_B]

### Nets
ETH_VDD_3V3: C24.2 IC6.8(VOUT1)
GND: C12.1 C13.2 C14.2 C15.1 C16.2 C17.2 C21.1 C22.2 C23.2 C24.1 C25.1 C26.2 IC3.2(VSS) IC3.6(VBAT) IC3.9(EP) IC4.2(VSS) IC4.6(VBAT) IC4.9(EP) IC6.2(GND) IC6.9(EP) R34.1 R37.1
VDD_3V3_OUT: C25.2 C26.1 IC6.7(VOUT2)
VDD_5V_HIPOWER: C13.1 C14.1 IC3.8(OUT)
VDD_5V_IN: C12.2 C15.2 C21.2 C22.1 IC3.1(IN) IC4.1(IN) IC6.1(VIN)
VDD_5V_PERIPH: C16.1 C17.1 IC4.8(OUT)
VDD_MCU: IC6.4(EN2) IC6.5(EN1)
nVDD_5V_HIPOWER_EN: R36.2 ; off-sheet nVDD_5V_HIPOWER_EN
nVDD_5V_HIPOWER_OC: R35.2 ; off-sheet nVDD_5V_HIPOWER_OC
nVDD_5V_PERIPH_EN: R39.2 ; off-sheet nVDD_5V_PERIPH_EN
nVDD_5V_PERIPH_OC: R38.2 ; off-sheet nVDD_5V_PERIPH_OC
NetC23_1: C23.1 IC6.3(BYP)
NetIC3_4: IC3.4(~{FAULT}) R35.1
NetIC3_5: IC3.5(~{CE}) R36.1
NetIC3_7: IC3.7(ILIM) R34.2
NetIC4_4: IC4.4(~{FAULT}) R38.1
NetIC4_5: IC4.5(~{CE}) R39.1
NetIC4_7: IC4.7(ILIM) R37.2

Not connected (* = marked no-connect by the designer): IC3 3(NC)*; IC4 3(NC)*; IC6 6(NC)*

### Notes on the sheet
- HIPOWER SWITCH
- POWER ETH & VDD_3V3
- PERIPHERAL SWITCH
- THIS DOCUMENT AND THE DATA DISCLOSED HEREIN OR
- HEREWITH IS THE PROPERTY OF ALTIUM LIMITED AND MAY
- DWG NO:
- REVISION
- REV:
- DESCRIPTION
- DATE
- APPROVED
- BE FREELY DISTRIBUTED IN WHOLE. NO RIGHTS ARE
- RESERVED OR EXPRESS OR IMPLIED WARANTEE GIVEN.
- ENG:
- APPROVALS
- PROJECT
- DSN:
- CHK:
- REFERENCE DOCUMENTS
- PROJECT REVISION:
- TITLE
- DOCUMENT REVISION:
- DESIGN ITEM:
- BOM:
- FAB DWG:
- PCB DWG:
- ASSY DWG:
- SCALE:
- A3
- SIZE
- CAGE CODE
- FILE NAME
- DWG NO.
- SHEET
- OF
- REV

### Library data of the parts
C12 C15 = CMP-2000-05458-2: CAP CER 22UF 25V X5R 1210; Manufacturer: Murata Electronics North America; Possible Substitute: GRM32ER61E226KE15K; Other Names: 490-3889-2; Material: Ceramic; Tolerance: 10%; Digikey Description: CAP CER 22UF 25V X5R 1210; Mouser Description: Multilayer Ceramic Capacitors MLCC - SMD/SMT 1210 22uF 25volts X5R 10%; Device Class L2: Capacitors; Height: 2.7mm; Temperature Characteristic: X5R; Category: Cap; RoHS: TRUE; Operating Temperature: -55°C ~ 85°C; Temperature: -55°C to +85°C; Lead Free: Yes; Package: GRM32; Temperature Range High: +85°C; Package / Case: 1210 (3225 Metric); Standard Package: 1,000; Packaging: Cut Tape (CT); Capacitance: 22uF; Thickness (Max): 0.106" (2.70mm); Value: 22uF; Automotive: No; Device Class L1: Passive Components; Voltage - Rated: 25V; Temperature Range Low: -55°C; Size / Dimension: 0.126" L x 0.098" W (3.20mm x 2.50mm); ComponentLink2Description: Datasheet; Device Class L3: Ceramic Capacitors; Temperature Coefficient: X5R; ComponentLink2URL: https://search.murata.co.jp/Ceramy/image/img/A01X/G101/ENG/GRM32ER61E226KE15-01A.pdf; Voltage Rating: 25V; Manufacturer Part Number: GRM32ER61E226KE15L; Octopart: https://octopart.com/grm32er61e226ke15l-murata-197441; Applications: General Purpose; Mounting Type: Surface Mount, MLCC
C13 C14 C16 C17 = CMP-2000-05451-2: as C4 on sheet S2_Power; RoHS Compliant: Yes; Dielectric: X5R; Case Code (Imperial): 0805; Min Operating Temperature: -55°C; Length: 2mm; Voltage Rating: 10V; Lead Free: Lead Free; Weight: 0.000194oz; Resistor Type: Ceramic; Dielectric Material: Ceramic; Max Operating Temperature: 85°C; Height: 1.25mm; Width: 0.049inch; Depth: 1.25mm; Termination: SMD/SMT; Case/Package: 0805; Voltage Rating (DC): 10V; Voltage: 10V; Thickness: 0.057inch; Tolerance: 20%; REACH SVHC: No SVHC; Package Quantity: 1; Series: C; Case Code (Metric): 2012; Mount: Surface Mount; Packaging: Tape and Reel
C21 C24 C25 = CMP-1038-02215-1: CAP 10uF 16V ±20% 1210 (3225 Metric) Thickness 2.1mm SMD; Case-EIA: 1210; Tolerance: Â±20%; Case-Metric: 3225; Max Thickness: 2.1 mm; Rated Voltage: 16 V; Value: 10uF; Technology: SMT
C22 C23 C26 = CMP-03422-001121-1: CAP CER 0.1UF 16V X7R 0402; Manufacturer: YAGEO; Manufacturer Part Number: CC0402KPX7R7BB104; Material: Ceramic; Temperature Coefficient: 30ppm/°C; Automotive Grade: NA; Tolerance: 0.1; Digikey Description: CAP CER 0.1UF 16V X7R 0402; Temperature Range Low: -55°C; Footprint Url: http://www.yageo.com/exep/pages/download/literatures/UPY-C_GEN_24.pdf; RoHS: TRUE; Device Class L3: Ceramic Capacitors; Temperature Characteristic: X7R; Capacitance: 100 nF; Package: CC0402; Device Class L1: Passive Components; Lead Free: Yes; Temperature Range High: +125°C; Category: Cap; Mouser Description: 0402 0.1 uF 16 V ±10% Tolerance X7R SMT Multilayer Ceramic Capacitor; Voltage Rating: 16 V; Value: 100 nF; ComponentLink2Description: Datasheet; Automotive: No; Octopart: https://octopart.com/cc0402kpx7r7bb104-yageo-21548559; ComponentLink2URL: http://www.yageo.com/documents/recent/UPY-GP_NP0_16V-to-50V_16.pdf; Height: 0.55mm; Device Class L2: Capacitors; Temperature: -55°C to +125°C; Ipc Land Pattern Name: CAPC10050X50
IC3 IC4 = CMP-0321-00484-2: Overvoltage & Overcurrent Protection IC & Li+ Charger Front-End Protection IC, -40 to 125 degC, 8-pin WSON (DSG), Green (RoHS & no Sb/Br); Manufacturer: Texas Instruments; SubFamily: Charger Front End Protection; NiMH: N; PackageReference: DSG0008A; PackageVersion: revB, Oct-2010; Code_JEDEC: MO-229; DatasheetVersion: SLUS817A; NiCd: N; Over Voltage Protection: N; PackageDescription: 8-Pin Plastic Small Outline No-Lead, 2 x 2 x 0.8 mm Body, 0.5 mm Pitch, Exposed Pad; Eco-Plan: Green (RoHS & no Sb/Br); Lead Acid: N; ComponentLink1URL: http://www.ti.com/general/docs/lit/getliterature.tsp?genericPartNumber=BQ24315&fileType=pdf; ComponentLink1Description: Datasheet; Li-Ion: N; Mounting Technology: Surface Mount; Li-Polymer: N; PartNumber: BQ24315DSGR
IC6 = MIC5330-SSYML-TR: Integrated Circuit; Manufacturer_Name: Microchip; Datasheet Link: http://www.microchip.com/mymicrochip/filehandler.aspx?ddocname=en579824; Height: 0.95mm; Manufacturer_Part_Number: MIC5330-SSYML-TR; Mouser Part Number: 998-MIC5330-SSYMLTR; Mouser Price/Stock: https://www.mouser.co.uk/ProductDetail/Microchip-Technology/MIC5330-SSYML-TR?qs=U6T8BxXiZAVlV%252Bccuslf5g%3D%3D; Arrow Part Number: MIC5330-SSYML-TR; Arrow Price/Stock: https://www.arrow.com/en/products/mic5330-ssyml-tr/microchip-technology?region=nac
R34 R37 = CMP-1011-00647-2: Manufacturer: Panasonic; Part Number: ERJ-2RKF1692X
R35 R36 R38 R39 = CMP-2002-01155-2: RES SMD 47K OHM 1% 1/10W 0402; Resistance: 47kR; Voltage Rating: 50V; Power Rating: 100mW; Temperature Coefficient: 100ppm/°C; Contact Plating: Tin; Radiation Hardening: No; Case/Package: 0402; Length: 1mm; Termination: SMD/SMT; RoHS Compliant: Yes; Resistor Type: Thick Film; Voltage Rating (DC): 50V; Depth: 0.5mm; Series: ERJ; Construction: Rectangular; REACH SVHC: No SVHC; Min Operating Temperature: -55°C; Packaging: Tape and Reel; Max Power Dissipation: 100mW; Military Standard: Not; Package Quantity: 1; Resistance Tolerance: 1%; Case Code (Metric): 1005; Technology: THICK FILM; Height: 0.35mm; Max Operating Temperature: 155°C; Number of Pins: 2; Tolerance: 1%; Case Code (Imperial): 0402; Width: 0.5mm; Number of Terminations: 2; Mount: Surface Mount; Features: Automotive AEC-Q200; Lead Free: Lead Free

## Sheet S4_Pwm_Ports.SchDoc
size 420 x 297 mm; SheetNumber: 4; SheetTotal: 8
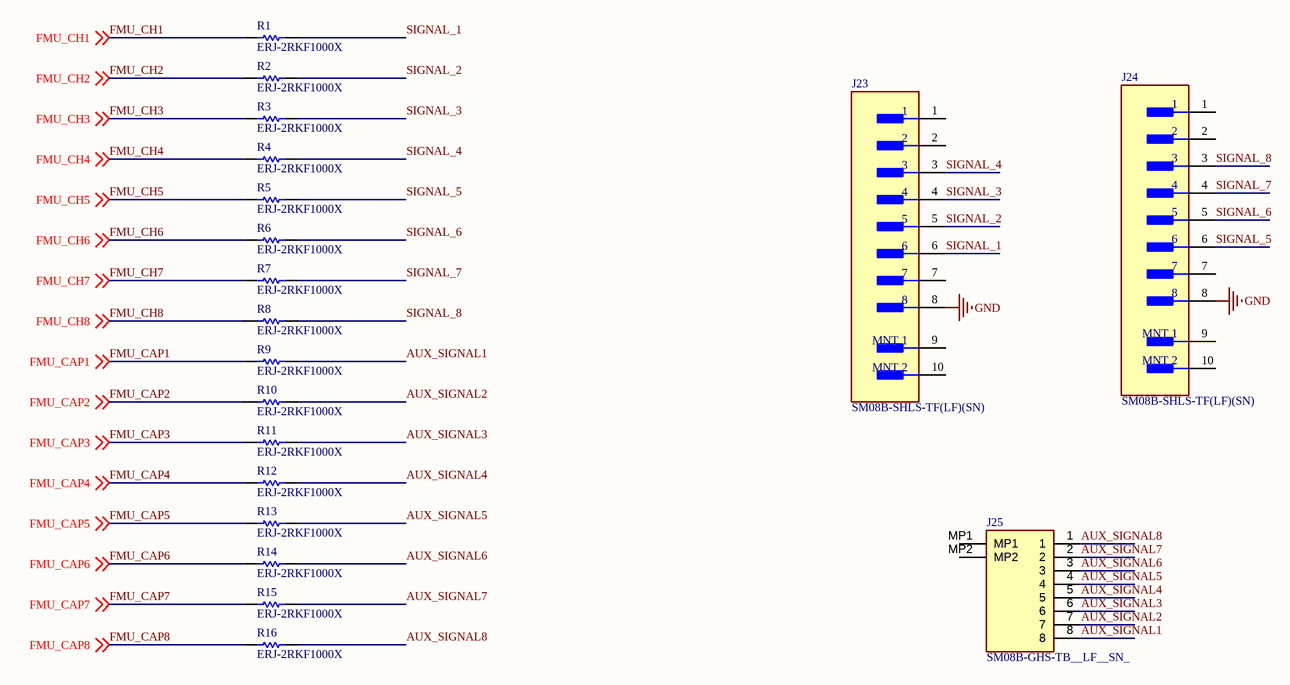
[diagram p3: S4_Pwm_Ports.SchDoc]

### Parts
J23  SM08B-SHLS-TF(LF)(SN)  [FP-SM08B-SHLS-TF_LF_SN-MFG]
J24  SM08B-SHLS-TF(LF)(SN)  [FP-SM08B-SHLS-TF_LF_SN-MFG]
J25  SM08B-GHS-TB__LF__SN_  [SM08BGHSTBLFSN]
R1  ERJ-2RKF1000X  [RESC1005X40X25LL05T05]
R2  ERJ-2RKF1000X  [RESC1005X40X25LL05T05]
R3  ERJ-2RKF1000X  [RESC1005X40X25LL05T05]
R4  ERJ-2RKF1000X  [RESC1005X40X25LL05T05]
R5  ERJ-2RKF1000X  [RESC1005X40X25LL05T05]
R6  ERJ-2RKF1000X  [RESC1005X40X25LL05T05]
R7  ERJ-2RKF1000X  [RESC1005X40X25LL05T05]
R8  ERJ-2RKF1000X  [RESC1005X40X25LL05T05]
R9  ERJ-2RKF1000X  [RESC1005X40X25LL05T05]
R10  ERJ-2RKF1000X  [RESC1005X40X25LL05T05]
R11  ERJ-2RKF1000X  [RESC1005X40X25LL05T05]
R12  ERJ-2RKF1000X  [RESC1005X40X25LL05T05]
R13  ERJ-2RKF1000X  [RESC1005X40X25LL05T05]
R14  ERJ-2RKF1000X  [RESC1005X40X25LL05T05]
R15  ERJ-2RKF1000X  [RESC1005X40X25LL05T05]
R16  ERJ-2RKF1000X  [RESC1005X40X25LL05T05]

### Nets
GND: J23.8 J24.8
AUX_SIGNAL1: J25.8 R9.2
AUX_SIGNAL2: J25.7 R10.2
AUX_SIGNAL3: J25.6 R11.2
AUX_SIGNAL4: J25.5 R12.2
AUX_SIGNAL5: J25.4 R13.2
AUX_SIGNAL6: J25.3 R14.2
AUX_SIGNAL7: J25.2 R15.2
AUX_SIGNAL8: J25.1 R16.2
FMU_CAP1: R9.1 ; off-sheet FMU_CAP1
FMU_CAP2: R10.1 ; off-sheet FMU_CAP2
FMU_CAP3: R11.1 ; off-sheet FMU_CAP3
FMU_CAP4: R12.1 ; off-sheet FMU_CAP4
FMU_CAP5: R13.1 ; off-sheet FMU_CAP5
FMU_CAP6: R14.1 ; off-sheet FMU_CAP6
FMU_CAP7: R15.1 ; off-sheet FMU_CAP7
FMU_CAP8: R16.1 ; off-sheet FMU_CAP8
FMU_CH1: R1.1 ; off-sheet FMU_CH1
FMU_CH2: R2.1 ; off-sheet FMU_CH2
FMU_CH3: R3.1 ; off-sheet FMU_CH3
FMU_CH4: R4.1 ; off-sheet FMU_CH4
FMU_CH5: R5.1 ; off-sheet FMU_CH5
FMU_CH6: R6.1 ; off-sheet FMU_CH6
FMU_CH7: R7.1 ; off-sheet FMU_CH7
FMU_CH8: R8.1 ; off-sheet FMU_CH8
SIGNAL_1: J23.6 R1.2
SIGNAL_2: J23.5 R2.2
SIGNAL_3: J23.4 R3.2
SIGNAL_4: J23.3 R4.2
SIGNAL_5: J24.6 R5.2
SIGNAL_6: J24.5 R6.2
SIGNAL_7: J24.4 R7.2
SIGNAL_8: J24.3 R8.2

Not connected (* = marked no-connect by the designer): J23 1 2 7 9(MNT_1) 10(MNT_2); J24 1 2 7 9(MNT_1) 10(MNT_2); J25 MP1 MP2

### Notes on the sheet
- THIS DOCUMENT AND THE DATA DISCLOSED HEREIN OR
- HEREWITH IS THE PROPERTY OF ALTIUM LIMITED AND MAY
- DWG NO:
- REVISION
- REV:
- DESCRIPTION
- DATE
- APPROVED
- BE FREELY DISTRIBUTED IN WHOLE. NO RIGHTS ARE
- RESERVED OR EXPRESS OR IMPLIED WARANTEE GIVEN.
- ENG:
- APPROVALS
- PROJECT
- DSN:
- CHK:
- REFERENCE DOCUMENTS
- PROJECT REVISION:
- TITLE
- DOCUMENT REVISION:
- DESIGN ITEM:
- BOM:
- FAB DWG:
- PCB DWG:
- ASSY DWG:
- SCALE:
- A3
- SIZE
- CAGE CODE
- FILE NAME
- DWG NO.
- SHEET
- OF
- REV

### Library data of the parts
J23 J24 = CMP-17439-000660-1: CONN HEADER SMD R/A 8POS 1MM; Number of Positions: 8; Voltage Rating: 50V; Contact Material: Bronze; Contact Shape: Rectangular; Insulation Material: Nylon; Min Operating Temperature: -25°C; Contact Type: Outer Shroud Contact; Packaging: Cut Tape; Termination: Solder; Series: SHL; Flammability Rating: UL94 V-0; Mount: Surface Mount; Insulation Color: Natural; Lead Free: Lead Free; Contact Finish - Mating: TIN; Fastening Type: Pull; Number of Rows: 1; Max Operating Temperature: 85°C; Connector Type: Header
J25 = SM08B-GHS-TB__LF__SN_: Connector; Manufacturer_Name: JST (JAPAN SOLDERLESS TERMINALS); Manufacturer_Part_Number: SM08B-GHS-TB (LF)(SN); Datasheet Link: https://www.arrow.com/en/products/sm08b-ghs-tb-lf-sn/jst-manufacturing; Height: 4.25mm; Arrow Part Number: SM08B-GHS-TB (LF)(SN); Arrow Price/Stock: https://www.arrow.com/en/products/sm08b-ghs-tb-lf-sn/jst-manufacturing
R1-R16 = CMP-2002-00605-3: Chip Resistor, 100 Ohm, +/- 1%, 100 mW, -55 to 155 degC, 0402 (1005 Metric), RoHS, Tape and Reel; Manufacturer: Basic Passives; Power Rating: 100 mW; Resistance: 100 Ohm; Voltage Rating: 50 V; Case\/Package: 0402; Width: 0.5 mm; Pins: 2; ComponentLink2Description: Datasheet; PackageReference: 0402; Height: 0.35 mm; Tolerance: 1%; DatasheetVersion: 04/2015; Case Code (Imperial): 0402; Min Operating Temperature: -55 degC; Radiation Hardening: No; Length: 1 mm; Package Quantity: 10000; PackageDescription: 2-Pin Surface Mount Device, Body 1 x 0.5 mm; Mounting Technology: Surface Mount; Case Code (Metric): 1005; Packaging: Tape and Reel; ComponentLink1URL: http://www.panasonic.com/; RoHSCompliant: true; Max Operating Temperature: 155 degC; REACH SVHC: Yes; PartNumber: ERJ-2RKF1000X; ComponentLink1Description: Manufacturer URL; ComponentLink2URL: http://industrial.panasonic.com/cdbs/www-data/pdf/RDA0000/AOA0000C86.pdf; Mount: Surface Mount

## Sheet S5_Gps_Telem_Ports.SchDoc
size 420 x 297 mm; SheetNumber: 5; SheetTotal: 9
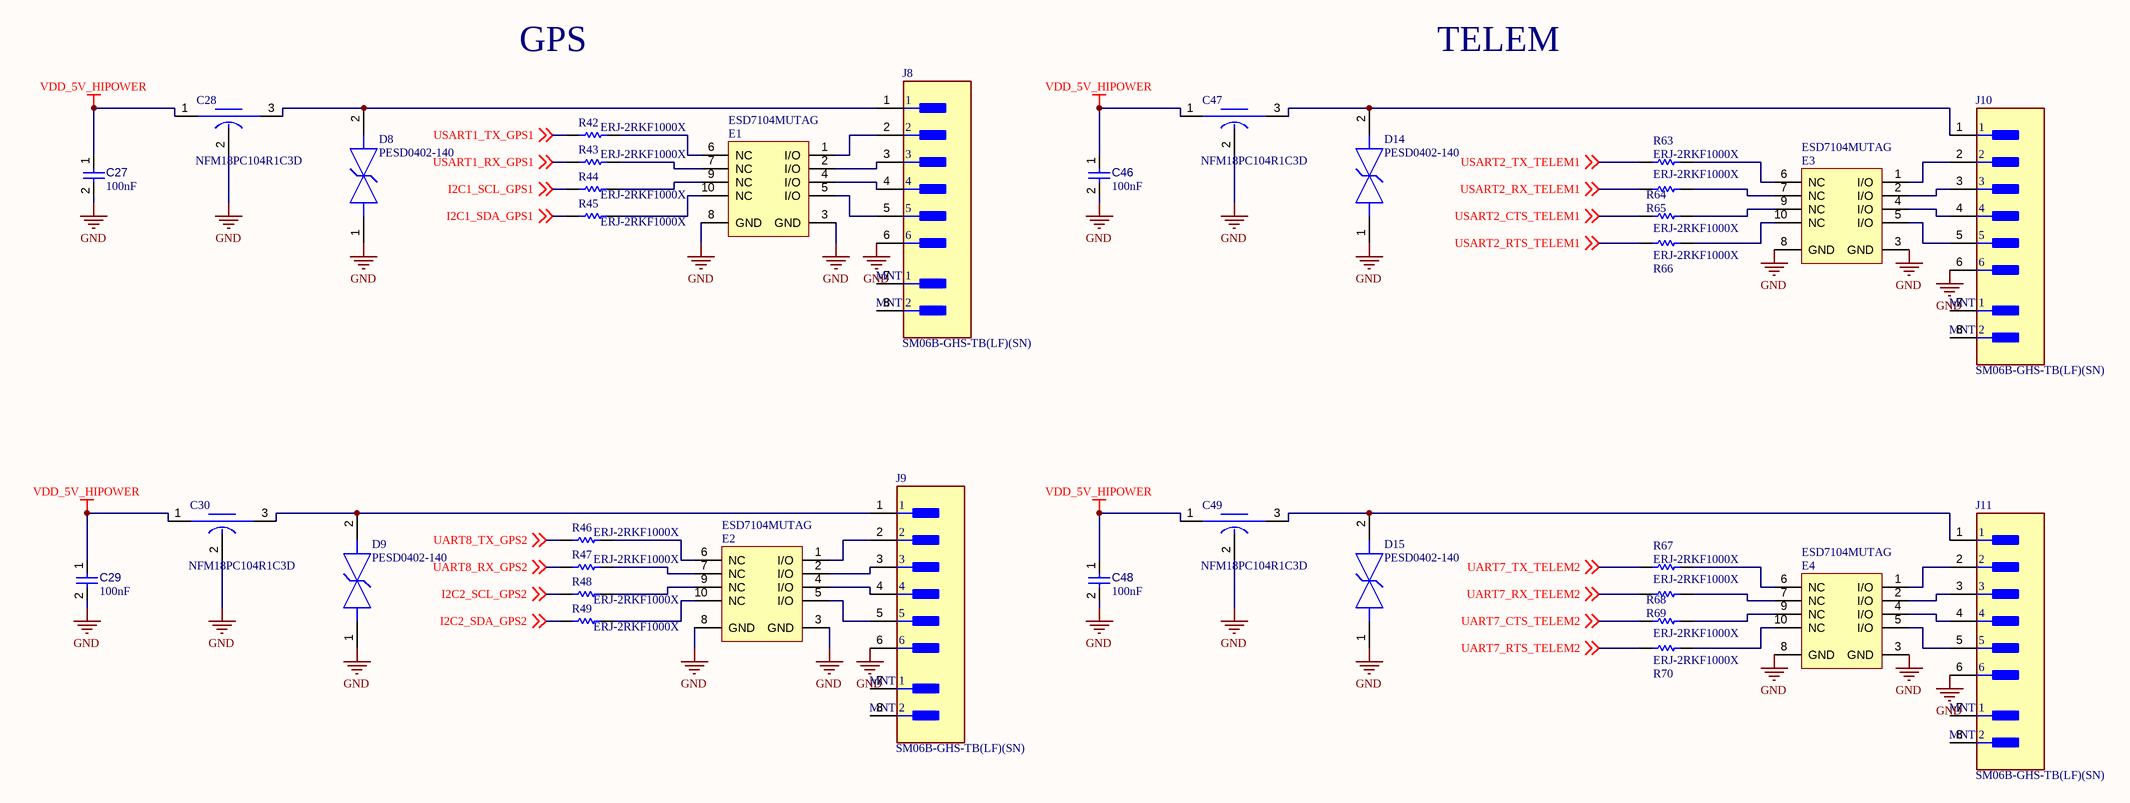
[diagram p4: S5_Gps_Telem_Ports.SchDoc]

### Parts
C27  value 100nF  [CAPC0402(1005)60_L]  (hidden comment: Capacitor 100nF +/-20% 25V 0402)
C28  NFM18PC104R1C3D  [FP-NFM18-0_1-e0_15_0_35-MFG]
C29  value 100nF  [CAPC0402(1005)60_L]  (hidden comment: Capacitor 100nF +/-20% 25V 0402)
C30  NFM18PC104R1C3D  [FP-NFM18-0_1-e0_15_0_35-MFG]
C46  value 100nF  [CAPC0402(1005)60_L]  (hidden comment: Capacitor 100nF +/-20% 25V 0402)
C47  NFM18PC104R1C3D  [FP-NFM18-0_1-e0_15_0_35-MFG]
C48  value 100nF  [CAPC0402(1005)60_L]  (hidden comment: Capacitor 100nF +/-20% 25V 0402)
C49  NFM18PC104R1C3D  [FP-NFM18-0_1-e0_15_0_35-MFG]
D8  PESD0402-140  [FP-PESD0402-MFG]
D9  PESD0402-140  [FP-PESD0402-MFG]
D14  PESD0402-140  [FP-PESD0402-MFG]
D15  PESD0402-140  [FP-PESD0402-MFG]
E1  ESD7104MUTAG  [ONSC-UDFN-10-517BB-01_V]
E2  ESD7104MUTAG  [ONSC-UDFN-10-517BB-01_V]
E3  ESD7104MUTAG  [ONSC-UDFN-10-517BB-01_V]
E4  ESD7104MUTAG  [ONSC-UDFN-10-517BB-01_V]
J8  SM06B-GHS-TB(LF)(SN)  [FP-SM06B-GHS-TB_LF_SN-MFG]
J9  SM06B-GHS-TB(LF)(SN)  [FP-SM06B-GHS-TB_LF_SN-MFG]
J10  SM06B-GHS-TB(LF)(SN)  [FP-SM06B-GHS-TB_LF_SN-MFG]
J11  SM06B-GHS-TB(LF)(SN)  [FP-SM06B-GHS-TB_LF_SN-MFG]
R42  ERJ-2RKF1000X  [RESC1005X40X25LL05T05]
R43  ERJ-2RKF1000X  [RESC1005X40X25LL05T05]
R44  ERJ-2RKF1000X  [RESC1005X40X25LL05T05]
R45  ERJ-2RKF1000X  [RESC1005X40X25LL05T05]
R46  ERJ-2RKF1000X  [RESC1005X40X25LL05T05]
R47  ERJ-2RKF1000X  [RESC1005X40X25LL05T05]
R48  ERJ-2RKF1000X  [RESC1005X40X25LL05T05]
R49  ERJ-2RKF1000X  [RESC1005X40X25LL05T05]
R63  ERJ-2RKF1000X  [RESC1005X40X25LL05T05]
R64  ERJ-2RKF1000X  [RESC1005X40X25LL05T05]
R65  ERJ-2RKF1000X  [RESC1005X40X25LL05T05]
R66  ERJ-2RKF1000X  [RESC1005X40X25LL05T05]
R67  ERJ-2RKF1000X  [RESC1005X40X25LL05T05]
R68  ERJ-2RKF1000X  [RESC1005X40X25LL05T05]
R69  ERJ-2RKF1000X  [RESC1005X40X25LL05T05]
R70  ERJ-2RKF1000X  [RESC1005X40X25LL05T05]

### Nets
GND: C27.2 C28.2(GND) C29.2 C30.2(GND) C46.2 C47.2(GND) C48.2 C49.2(GND) D8.1 D9.1 D14.1 D15.1 E1.3(GND) E1.8(GND) E2.3(GND) E2.8(GND) E3.3(GND) E3.8(GND) E4.3(GND) E4.8(GND) J8.6 J9.6 J10.6 J11.6
VDD_5V_HIPOWER: C27.1 C28.1(Input) C29.1 C30.1(Input) C46.1 C47.1(Input) C48.1 C49.1(Input)
I2C1_SCL_GPS1: R44.1 ; off-sheet I2C1_SCL_GPS1
I2C1_SDA_GPS1: R45.1 ; off-sheet I2C1_SDA_GPS1
I2C2_SCL_GPS2: R48.1 ; off-sheet I2C2_SCL_GPS2
I2C2_SDA_GPS2: R49.1 ; off-sheet I2C2_SDA_GPS2
UART7_CTS_TELEM2: R69.1 ; off-sheet UART7_CTS_TELEM2
UART7_RTS_TELEM2: R70.1 ; off-sheet UART7_RTS_TELEM2
UART7_RX_TELEM2: R68.1 ; off-sheet UART7_RX_TELEM2
UART7_TX_TELEM2: R67.1 ; off-sheet UART7_TX_TELEM2
UART8_RX_GPS2: R47.1 ; off-sheet UART8_RX_GPS2
UART8_TX_GPS2: R46.1 ; off-sheet UART8_TX_GPS2
USART1_RX_GPS1: R43.1 ; off-sheet USART1_RX_GPS1
USART1_TX_GPS1: R42.1 ; off-sheet USART1_TX_GPS1
USART2_CTS_TELEM1: R65.1 ; off-sheet USART2_CTS_TELEM1
USART2_RTS_TELEM1: R66.1 ; off-sheet USART2_RTS_TELEM1
USART2_RX_TELEM1: R64.1 ; off-sheet USART2_RX_TELEM1
USART2_TX_TELEM1: R63.1 ; off-sheet USART2_TX_TELEM1
NetC28_3: C28.3(Output) D8.2 J8.1
NetC30_3: C30.3(Output) D9.2 J9.1
NetC47_3: C47.3(Output) D14.2 J10.1
NetC49_3: C49.3(Output) D15.2 J11.1
NetE1_1: E1.1(I/O) J8.2
NetE1_2: E1.2(I/O) J8.3
NetE1_4: E1.4(I/O) J8.4
NetE1_5: E1.5(I/O) J8.5
NetE1_6: E1.6(NC) R42.2
NetE1_7: E1.7(NC) R43.2
NetE1_9: E1.9(NC) R44.2
NetE1_10: E1.10(NC) R45.2
NetE2_1: E2.1(I/O) J9.2
NetE2_2: E2.2(I/O) J9.3
NetE2_4: E2.4(I/O) J9.4
NetE2_5: E2.5(I/O) J9.5
NetE2_6: E2.6(NC) R46.2
NetE2_7: E2.7(NC) R47.2
NetE2_9: E2.9(NC) R48.2
NetE2_10: E2.10(NC) R49.2
NetE3_1: E3.1(I/O) J10.2
NetE3_2: E3.2(I/O) J10.3
NetE3_4: E3.4(I/O) J10.4
NetE3_5: E3.5(I/O) J10.5
NetE3_6: E3.6(NC) R63.2
NetE3_7: E3.7(NC) R64.2
NetE3_9: E3.9(NC) R65.2
NetE3_10: E3.10(NC) R66.2
NetE4_1: E4.1(I/O) J11.2
NetE4_2: E4.2(I/O) J11.3
NetE4_4: E4.4(I/O) J11.4
NetE4_5: E4.5(I/O) J11.5
NetE4_6: E4.6(NC) R67.2
NetE4_7: E4.7(NC) R68.2
NetE4_9: E4.9(NC) R69.2
NetE4_10: E4.10(NC) R70.2

Not connected (* = marked no-connect by the designer): J8 7(MNT_1) 8(MNT_2); J9 7(MNT_1) 8(MNT_2); J10 7(MNT_1) 8(MNT_2); J11 7(MNT_1) 8(MNT_2)

### Notes on the sheet
- GPS
- TELEM
- THIS DOCUMENT AND THE DATA DISCLOSED HEREIN OR
- HEREWITH IS THE PROPERTY OF ALTIUM LIMITED AND MAY
- DWG NO:
- REVISION
- REV:
- DESCRIPTION
- DATE
- APPROVED
- BE FREELY DISTRIBUTED IN WHOLE. NO RIGHTS ARE
- RESERVED OR EXPRESS OR IMPLIED WARANTEE GIVEN.
- ENG:
- APPROVALS
- PROJECT
- DSN:
- CHK:
- REFERENCE DOCUMENTS
- PROJECT REVISION:
- TITLE
- DOCUMENT REVISION:
- DESIGN ITEM:
- BOM:
- FAB DWG:
- PCB DWG:
- ASSY DWG:
- SCALE:
- A3
- SIZE
- CAGE CODE
- FILE NAME
- DWG NO.
- SHEET
- OF
- REV

### Library data of the parts
C27 C29 C46 C48 = CMP-001-00065-4: as C6 on sheet S2_Power; Max Operating Temperature: 85°C; Min Operating Temperature: -55°C; Pins: 2; Voltage Rating: 25V; Mounting Technology: SMT; Case/Package: 0402
C28 C30 C47 C49 = CMP-06053-000054-1: Large Current 3 Terminals Low ESL Chip Multilayer Ceramic Capacitors for General Purpose, 0603, 0.10uF, 20%, 16V; Capacitance: 100nF; Insulation Resistance: 1GR; Current Rating: 2A; DC Resistance (DCR): 30mR; Case Code (Imperial): 0603; REACH SVHC: No SVHC; Width: 0.8mm; Case Code (Metric): 1608; Voltage Rating (DC): 16V; Case/Package: 0603; Packaging: Tape and Reel; Length: 1.6mm; Height: 0.6mm; Voltage: 16V; Depth: 0.8mm; Radiation Hardening: No; Max Operating Temperature: 125°C; Max Voltage Rating (DC): 16V; Voltage Rating: 16V; Max Current Rating: 2A; Tolerance: 20%; Min Operating Temperature: -55°C; Mount: PCB; Termination: Flat; Current: 2A; Package Quantity: 4000; Lead Free: Lead Free
D8 D9 D14 D15 = CMP-08607-000011-1: as D1 on sheet S2_Power; Temperature Range Low: -55°C; Lead Free: Yes; Temperature: -55°C to +125°C; Digikey Description: TVS DIODE 14V 40V 0402; Automotive: Yes; Device Class L2: TVS Diodes; Reverse Standoff Voltage: 14V; Device Class L1: Circuit Protection; Ipc Land Pattern Name: DIOC10050X33; Manufacturer Part Number: PESD0402-140; Breakdown Voltage: 14V; Height: 0.43mm; Clamping Voltage: 40V; RoHS: TRUE; Temperature Range High: +125°C; Device Class L3: unset; Octopart: https://octopart.com/pesd0402-140-littelfuse-74215061; Package: PESD0402; ComponentLink2URL: https://www.littelfuse.com/~/media/electronics/datasheets/polymer_esd_suppressors/littelfuse_polymer_esd_suppressor_pesd_catalog_datasheet.pdf.pdf; Category: Diode; ComponentLink2Description: Datasheet
E1-E4 = CMP-1063-00242-1: Transient Voltage Suppressor, Low Capacitance ESD Protection for High Speed Data, 10-Pin UDFN, Pb-Free, Tape and Reel; Manufacturer: On Semiconductor; IR Max (uA): 1; Number of Lines: 4; VRWM Max (V): 5; Direction: Bidirectional; V(BR) Min (V): 5.5; PackageDescription: 10-Pin Small Outline No-Lead, Body 2.5 x 1 mm, Pitch 0.5 mm; ComponentLink3URL: http://www.onsemi.com/pub_link/Collateral/517BB.PDF; PackageReference: UDFN-10-517BB-01; Mounting Technology: Surface Mount; PartNumber: ESD7104MUTAG; ComponentLink1URL: http://www.onsemi.com/; ComponentLink1Description: Manufacturer URL; DatasheetVersion: Rev. 2; ComponentLink2Description: Datasheet; ComponentLink2URL: http://www.onsemi.cn/pub_link/Collateral/ESD7104-D.PDF; PackageVersion: Rev. O, 11/2009; Packing: Tape and Reel; RoHS: Pb-Free; ComponentLink3Description: Package Specification
J8-J11 = CMP-17439-000061-1: CONN HEADER SMD R/A 6POS 1.25MM; Number of Contacts: 6; Voltage Rating: 50V; Current Rating: 1A; Connector Type: Outer Shroud Contact; Contact Resistance: 50mR; Orientation: Right Angle; Max Operating Temperature: 85°C; Mount: Surface Mount; Packaging: Tape and Reel; Contact Plating: Tin; Depth: 4.05mm; Max Voltage Rating (AC): 50V; Lead Free: Lead Free; Pitch: 1.25mm; Number of Positions: 6; Max Current Rating: 1A; Termination: Solder; Min Operating Temperature: -25°C; Housing Color: Beige; Fastening Type: Ramp; Length: 10.75mm; Color: Natural; Contact Material: Bronze; Housing Material: Polyamide; Number of Rows: 1
R42-R49 R63-R70 = CMP-2002-00605-3: as R1 on sheet S4_Pwm_Ports; Width: 0.5 mm; Pins: 2; ComponentLink2Description: Datasheet; PackageReference: 0402; Height: 0.35 mm; Tolerance: 1%; DatasheetVersion: 04/2015; Case Code (Imperial): 0402; Min Operating Temperature: -55 degC; Radiation Hardening: No; Length: 1 mm; Package Quantity: 10000; PackageDescription: 2-Pin Surface Mount Device, Body 1 x 0.5 mm; Mounting Technology: Surface Mount; Case Code (Metric): 1005; Packaging: Tape and Reel; ComponentLink1URL: http://www.panasonic.com/; RoHSCompliant: true; Max Operating Temperature: 155 degC; REACH SVHC: Yes; PartNumber: ERJ-2RKF1000X; ComponentLink1Description: Manufacturer URL; ComponentLink2URL: http://industrial.panasonic.com/cdbs/www-data/pdf/RDA0000/AOA0000C86.pdf; Mount: Surface Mount